# Altium schematic sheet OPA.SchDoc
size 330 x 114 mm
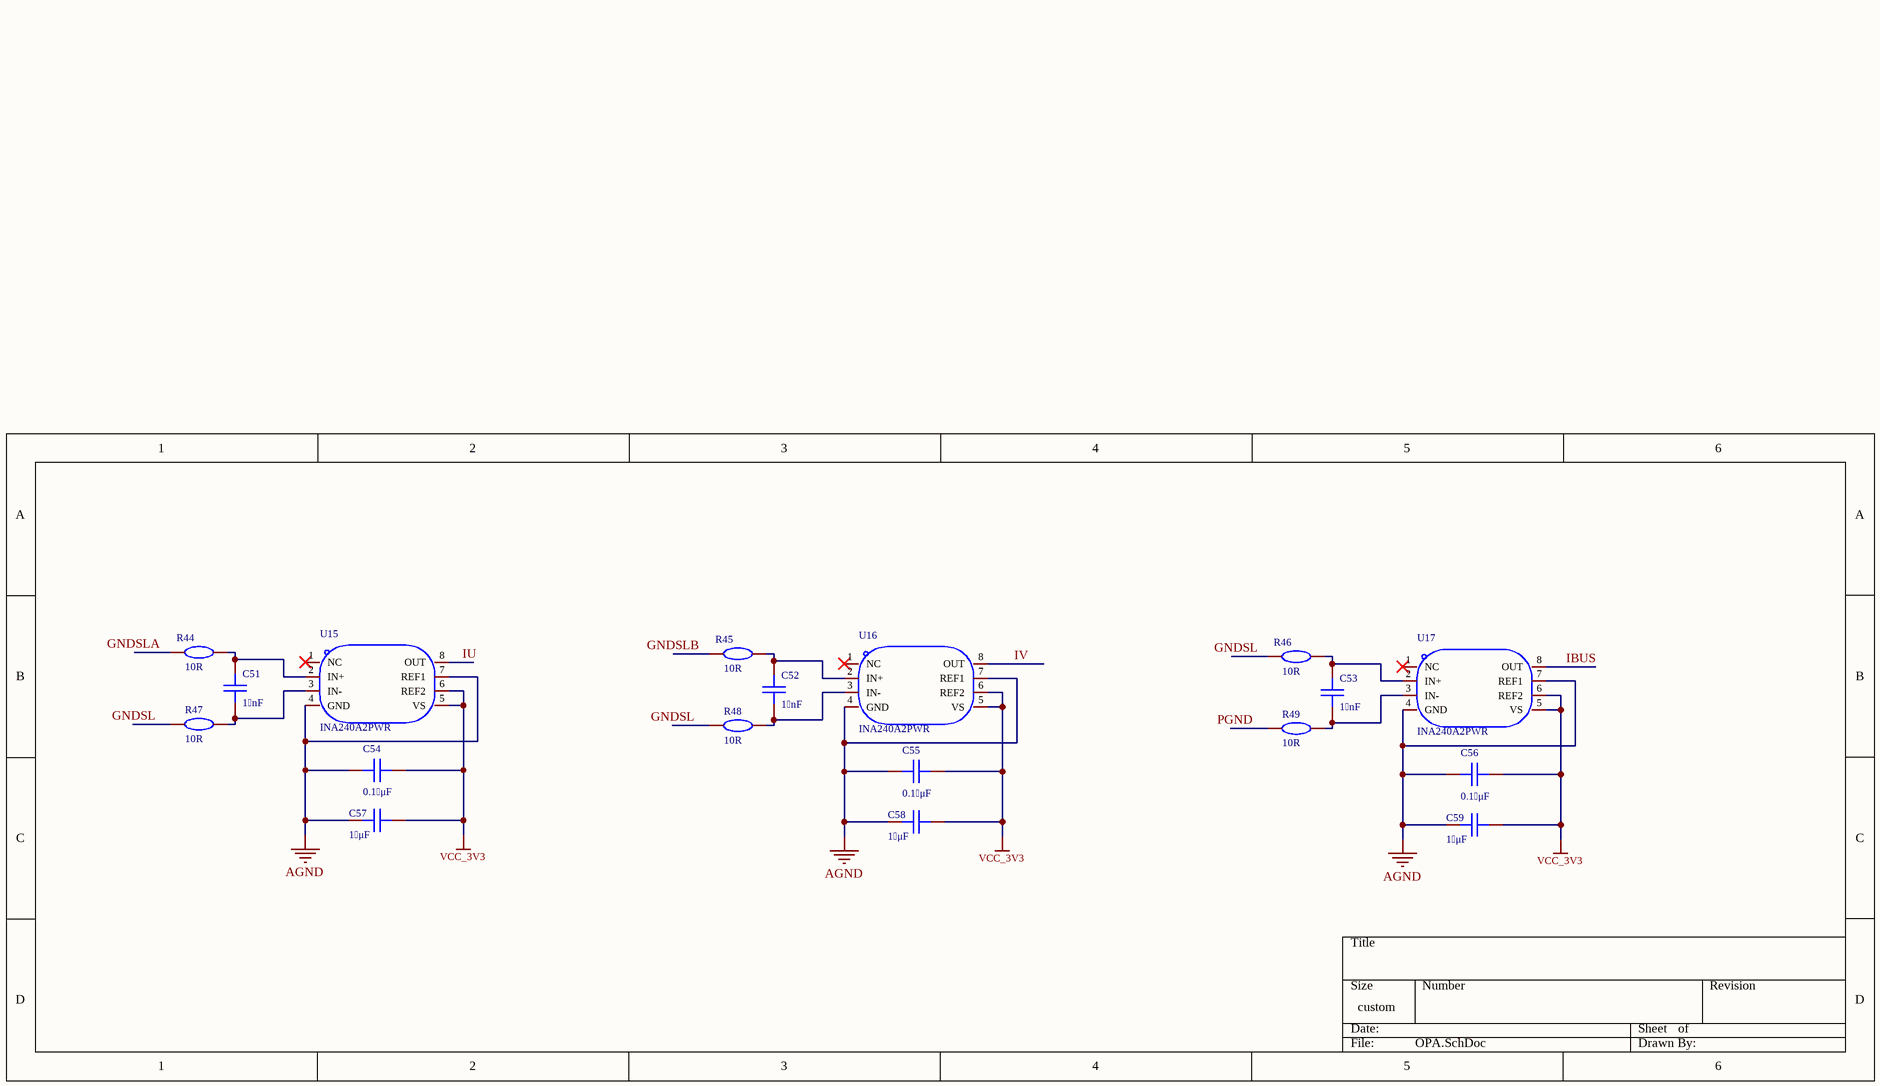
[diagram p0: OPA.SchDoc]

## Parts
C51  1 nF  [C0603]
C52  1 nF  [C0603]
C53  1 nF  [C0603]
C54  0.1 μF  [C0603]
C55  0.1 μF  [C0603]
C56  0.1 μF  [C0603]
C57  1 μF  [C0603]
C58  1 μF  [C0603]
C59  1 μF  [C0603]
R44  10R  [R0603]
R45  10R  [R0603]
R46  10R  [R0603]
R47  10R  [R0603]
R48  10R  [R0603]
R49  10R  [R0603]
U15  INA240A2PWR  [TSSOP-8_L4.4-W3.0-P0.65-LS6.4-BL]
U16  INA240A2PWR  [TSSOP-8_L4.4-W3.0-P0.65-LS6.4-BL]
U17  INA240A2PWR  [TSSOP-8_L4.4-W3.0-P0.65-LS6.4-BL]

## Nets
AGND: C54.2 C55.2 C56.2 C57.2 C58.2 C59.2 U15.4(GND) U15.7(REF1) U16.4(GND) U16.7(REF1) U17.4(GND) U17.7(REF1)
VCC_3V3: C54.1 C55.1 C56.1 C57.1 C58.1 C59.1 U15.5(VS) U15.6(REF2) U16.5(VS) U16.6(REF2) U17.5(VS) U17.6(REF2)
GNDSL: R46.2 R47.2 R48.2
GNDSLA: R44.2
GNDSLB: R45.2
IBUS: U17.8(OUT)
IU: U15.8(OUT)
IV: U16.8(OUT)
PGND: R49.2
NetC51_1: C51.1 R47.1 U15.3(IN-)
NetC51_2: C51.2 R44.1 U15.2(IN+)
NetC52_1: C52.1 R48.1 U16.3(IN-)
NetC52_2: C52.2 R45.1 U16.2(IN+)
NetC53_1: C53.1 R49.1 U17.3(IN-)
NetC53_2: C53.2 R46.1 U17.2(IN+)

Not connected (* = marked no-connect by the designer): U15 1(NC)*; U16 1(NC)*; U17 1(NC)*

## Library data of the parts
C51-C59 = CAP_0603: Symbol: Capacitance; 3D Model: ac125912035d415993ca9572d50418b1聨0819f05c4eef4c71ace90d822a990e87; 3D Model Transform: 62.992,31.496,0,0,0,0,0,0,0; ConvertToPcb: yes; ModelName: C0603_L1.6-W0.8-H0.8; Device: CAP_0603; Supplier Footprint: 0603; AddInBom: yes; FootprintName: C0603
  C51-C53: Value: 1 nF
  C54-C56: Value: 0.1 μF
  C57-C59: Value: 1 μF
R44-R49 = Res_0603: Symbol: 电阻; 3D Model: fc143cca1e79419f9cd78b61e9279f08聨0819f05c4eef4c71ace90d822a990e87; 3D Model Transform: 31.8897,63.7794,0,90,0,0,0,0,0; ConvertToPcb: yes; Device: Res_0603; Supplier Footprint: 0603; Value: 10R; AddInBom: yes; FootprintName: R0603; ModelName: R0603
U15-U17 = INA240A2PWR: 放大器数:单路;共模电压:-4V~80V;增益:50V/V;带宽:400kHz;; Manufacturer: TI(德州仪器); 3D Model: 85577802f9634e7e85ffa2fd25a37b6f聨0819f05c4eef4c71ace90d822a990e87; 3D Model Transform: 118.11,251.968,0,0,0,0,0,0,0; Number of Channels: 单路; Gain: 50V/V; Bandwidth: 400kHz; Ib - Input Bias Current: 90uA; Vos - Input Offset Voltage: 5uV; Differential Voltage: -80V~+80V; Single Supply: 2.7V~5.5V; Quiescent Current: 1.8mA; Input Offset Voltage Drift(Vos TC): 250nV/℃; Slew Rate: 2V/us; Common Mode Rejection Ratio (CMRR): 132dB; Noise density(eN): 40nV/√Hz@1kHz; AddInBom: yes; ModelName: TSSOP-8_L4.4-W3.0-P0.65-LS6.4-BL-2; Symbol: INA240A2PWR; Device: INA240A2PWR; LCSC Part Name: 具有增强型PWM抑制功能的高侧和低侧双向零漂移电流感测放大器; Supplier Part: C129949; Manufacturer Part: INA240A2PWR; Supplier Footprint: TSSOP-8; JLCPCB Part Class: Extended Part; Datasheet: https://www.ti.com/cn/lit/gpn/ina240; Supplier: LCSC; Vcm - Common Mode Voltage: -4V~80V; Operating Temperature: -40℃~+125℃; Maximum Power Supply Range (Vdd-Vss): -; Dual Supply: -; Output Current: -; Input Offset Current(Ios): -; Input Offset Current Drift (Ios TC): -; ConvertToPcb: yes; FootprintName: TSSOP-8_L4.4-W3.0-P0.65-LS6.4-BL